# Altium schematic sheet radxa_CM3J_SHEET-2.SchDoc
size A4; SheetNumber: 3; SheetTotal: 10
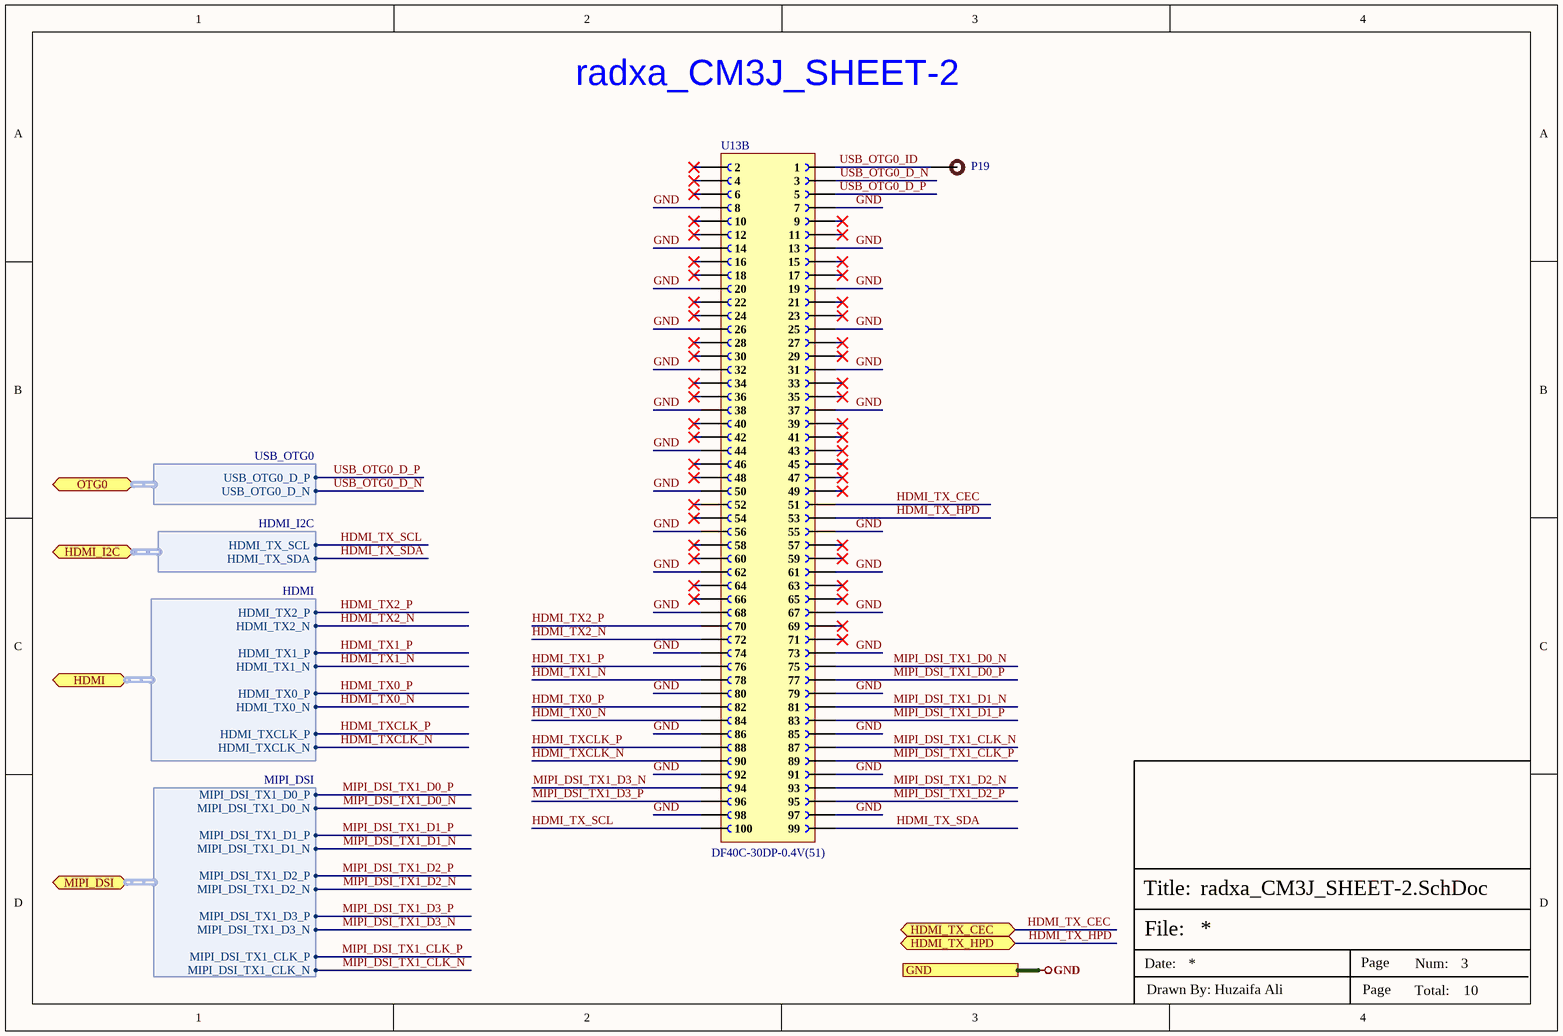
[diagram p0: radxa_CM3J_SHEET-2.SchDoc]

## Parts
P19  TEST POINT 0.5mm Dia  [Test-point - 0.5mm]  (value not drawn)  (no BOM)
U13B  DF40C-30DP-0.4V(51)  [DF40C-100DS-0.4V(51)]

## Ports
GND (see CAN_SHEET[3D], GPS_INTERFACE_SHEET[3D], HDMI2.0_SHEET[3D], JOYSTICK_BUTTON_SHEET[3D], MIPI_DISPLAY-SHEET[3D], MISCELLANEOUS_SHEET[3D], POWER_SHEET[3C], radxa_CM3J_SHEET-1[4C], TYPE-C_INTERFACE_SHEET[3D]), HDMI (bidir, harness HDMI, see HDMI2.0_SHEET[2D]), HDMI_I2C (bidir, harness HDMI_I2C, see HDMI2.0_SHEET[2D]), HDMI_TX_CEC (bidir, see HDMI2.0_SHEET[3D]), HDMI_TX_HPD (bidir, see HDMI2.0_SHEET[3D]), MIPI_DSI (bidir, harness MIPI_DSI, see MIPI_DISPLAY-SHEET[1D]), OTG0 (bidir, harness USB_OTG0, see TYPE-C_INTERFACE_SHEET[2D])

## Harnesses
MIPI_DSI: MIPI_DSI_TX1_D0_P, MIPI_DSI_TX1_D0_N, MIPI_DSI_TX1_D1_P, MIPI_DSI_TX1_D1_N, MIPI_DSI_TX1_D2_P, MIPI_DSI_TX1_D2_N, MIPI_DSI_TX1_D3_P, MIPI_DSI_TX1_D3_N, MIPI_DSI_TX1_CLK_P, MIPI_DSI_TX1_CLK_N
HDMI_I2C: HDMI_TX_SCL, HDMI_TX_SDA
HDMI: HDMI_TX2_P, HDMI_TX2_N, HDMI_TX1_P, HDMI_TX1_N, HDMI_TX0_P, HDMI_TX0_N, HDMI_TXCLK_P, HDMI_TXCLK_N
USB_OTG0: USB_OTG0_D_P, USB_OTG0_D_N

## Nets
GND: U13B.7 U13B.8 U13B.13 U13B.14 U13B.19 U13B.20 U13B.25 U13B.26 U13B.31 U13B.32 U13B.37 U13B.38 U13B.44 U13B.50 U13B.55 U13B.56 U13B.61 U13B.62 U13B.67 U13B.68 U13B.73 U13B.74 U13B.79 U13B.80 U13B.85 U13B.86 U13B.91 U13B.92 U13B.97 U13B.98 ; port GND
HDMI_TX0_N: U13B.84 ; port HDMI.HDMI_TX0_N
HDMI_TX0_P: U13B.82 ; port HDMI.HDMI_TX0_P
HDMI_TX1_N: U13B.78 ; port HDMI.HDMI_TX1_N
HDMI_TX1_P: U13B.76 ; port HDMI.HDMI_TX1_P
HDMI_TX2_N: U13B.72 ; port HDMI.HDMI_TX2_N
HDMI_TX2_P: U13B.70 ; port HDMI.HDMI_TX2_P
HDMI_TX_CEC: U13B.51 ; port HDMI_TX_CEC
HDMI_TX_HPD: U13B.53 ; port HDMI_TX_HPD
HDMI_TX_SCL: U13B.100 ; port HDMI_I2C.HDMI_TX_SCL
HDMI_TX_SDA: U13B.99 ; port HDMI_I2C.HDMI_TX_SDA
HDMI_TXCLK_N: U13B.90 ; port HDMI.HDMI_TXCLK_N
HDMI_TXCLK_P: U13B.88 ; port HDMI.HDMI_TXCLK_P
MIPI_DSI_TX1_CLK_N: U13B.87 ; port MIPI_DSI.MIPI_DSI_TX1_CLK_N
MIPI_DSI_TX1_CLK_P: U13B.89 ; port MIPI_DSI.MIPI_DSI_TX1_CLK_P
MIPI_DSI_TX1_D0_N: U13B.75 ; port MIPI_DSI.MIPI_DSI_TX1_D0_N
MIPI_DSI_TX1_D0_P: U13B.77 ; port MIPI_DSI.MIPI_DSI_TX1_D0_P
MIPI_DSI_TX1_D1_N: U13B.81 ; port MIPI_DSI.MIPI_DSI_TX1_D1_N
MIPI_DSI_TX1_D1_P: U13B.83 ; port MIPI_DSI.MIPI_DSI_TX1_D1_P
MIPI_DSI_TX1_D2_N: U13B.93 ; port MIPI_DSI.MIPI_DSI_TX1_D2_N
MIPI_DSI_TX1_D2_P: U13B.95 ; port MIPI_DSI.MIPI_DSI_TX1_D2_P
MIPI_DSI_TX1_D3_N: U13B.94 ; port MIPI_DSI.MIPI_DSI_TX1_D3_N
MIPI_DSI_TX1_D3_P: U13B.96 ; port MIPI_DSI.MIPI_DSI_TX1_D3_P
USB_OTG0_D_N: U13B.3 ; port OTG0.USB_OTG0_D_N
USB_OTG0_D_P: U13B.5 ; port OTG0.USB_OTG0_D_P
USB_OTG0_ID: P19.1 U13B.1

Not connected (* = marked no-connect by the designer): U13B 2* 4* 6* 9* 10* 11* 12* 15* 16* 17* 18* 21* 22* 23* 24* 27* 28* 29* 30* 33* 34* 35* 36* 39* 40* 41* 42* 43* 45* 46* 47* 48* 49* 52* 54* 57* 58* 59* 60* 63* 64* 65* 66* 69* 71*

## Notes on the sheet
- radxa_CM3J_SHEET-2
- File:
- Title:
- Date:
- Page
- Num:
- Total:
- Drawn By: Huzaifa Ali

## Library data of the parts
P19 = TEST POINT 0.5mm Dia: Test Point ON; Item Type: Test Point; Manufacturer Part Number: TEST POINT 0.5mm Dia
U13B = DF40C-30DP-0.4V(51): CONN RCPT 100POS SMD GOLD; Manufacturer: Hirose; Item Type: Headers and Wire Housings; Current Rating: 300mA; Voltage Rating: 30V; Connector Type: Plug; Number of Positions: 30; Contact Resistance: 90mR; Pitch: 0.4mm; Mated Stacking Heights: 4mm; Contact Pitch: 400um; Supplier: Future Electronics; LCSC Part Number: C597931; Manufacturer Part Number: DF40C-30DP-0.4V(51); RoHS: Yes; Stock: 10000; Pricing: 5000=0.405 (USD); Mounting Technology: Surface Mount; Contact Plating: Gold; Contact Material: Bronze,Copper Alloy; Housing Material: Polymer; Housing Color: Black; Package Quantity: 5000; Number of Rows: 2; Packaging: Tape and Reel; Termination: SMD/SMT; Number of Contacts: 30; Orientation: Straight; Series: DF40; Contact Voltage Rating (AC): 30V; Contact Voltage Rating (DC): 30V; Reach SVHC Compliant: No; Lead Free: Lead Free; RoHS Compliant: Yes; ComponentLink1URL: https://datasheet.ciiva.com/11746/0900766b80e0bfd2-11746269.pdf?src-supplier=Rs; ComponentLink1Description: https://datasheet.ciiva.com/11746/0900766b80e0bfd2-11746269.pdf?src-supplier=Rs; ComponentLink2URL: https://datasheet.ciiva.com/46408/1824826-46408902.pdf?src-supplier=Element14; ComponentLink2Description: https://datasheet.ciiva.com/46408/1824826-46408902.pdf?src-supplier=Element14